# Altium project Curso_Titans.PrjPcb (part 4 of 4)
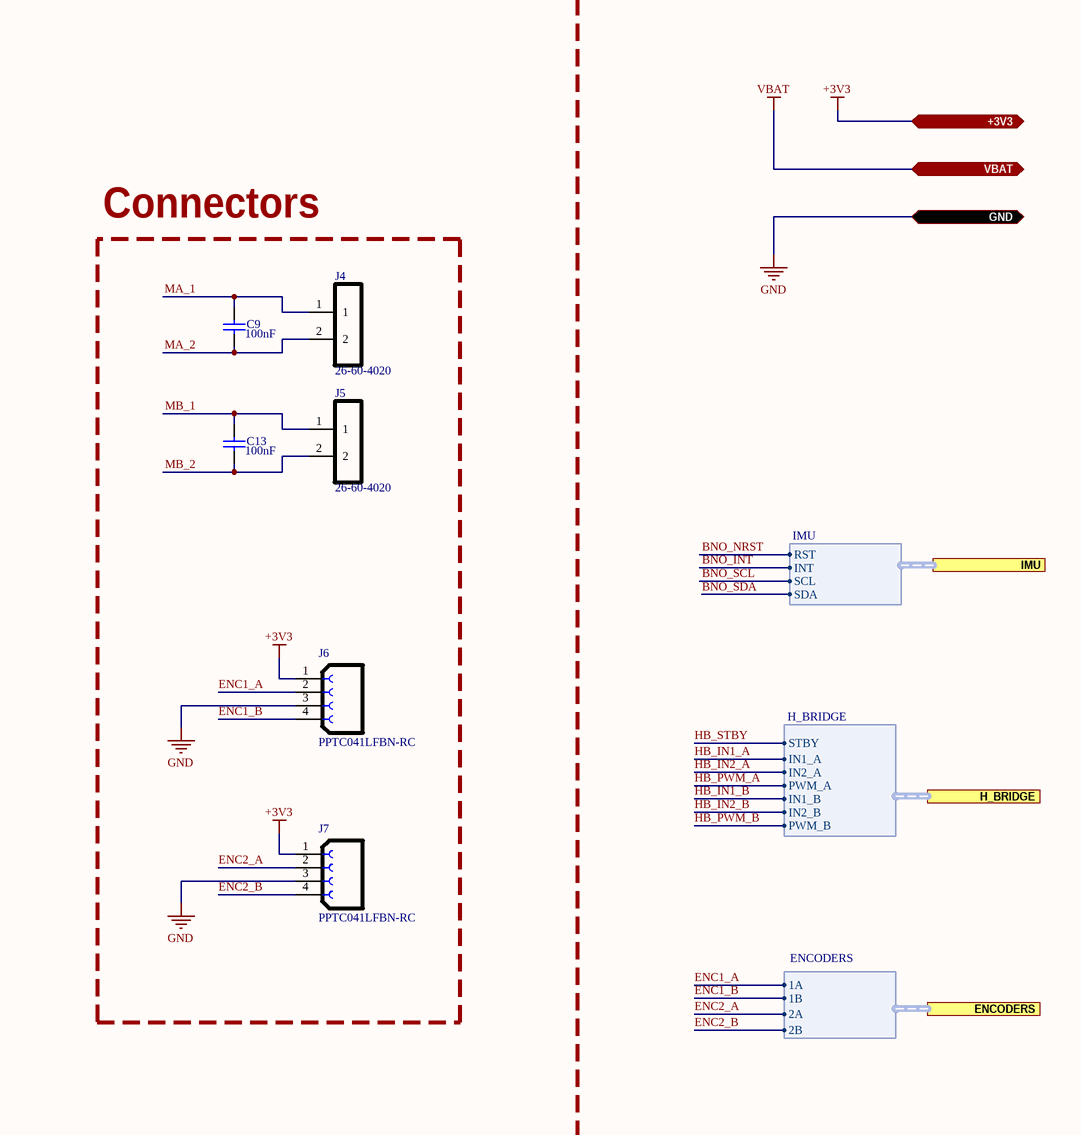
[diagram p7: peripherials.SchDoc, right]

## Nets that join several sheets
+3V3: power_supply (5 pins), logic_control (8 pins), peripherials (10 pins)
GND: power_supply (18 pins), logic_control (23 pins), peripherials (24 pins)
VBAT: power_supply (D1.2 J2.1 SW1.3), peripherials (7 pins)
BNO_INT: logic_control (U2.9), peripherials (U3.14)
BNO_NRST: logic_control (U2.8), peripherials (U3.11)
BNO_SCL: logic_control (R8.1 U2.23), peripherials (U3.19)
BNO_SDA: logic_control (R9.1 U2.31), peripherials (U3.20)
ENC1_A: logic_control (U2.19), peripherials (J6.2)
ENC1_B: logic_control (U2.20), peripherials (J6.4)
ENC2_A: logic_control (U2.21), peripherials (J7.2)
ENC2_B: logic_control (U2.22), peripherials (J7.4)
HB_IN1_A: logic_control (U2.5), peripherials (U4.21)
HB_IN1_B: logic_control (U2.12), peripherials (U4.17)
HB_IN2_A: logic_control (U2.6), peripherials (U4.22)
HB_IN2_B: logic_control (U2.17), peripherials (U4.16)
HB_PWM_A: logic_control (U2.7), peripherials (U4.23)
HB_PWM_B: logic_control (U2.18), peripherials (U4.15)
HB_STBY: logic_control (U2.4), peripherials (U4.19)
USB_MCU_N: power_supply (U1.3), logic_control (R13.1)
USB_MCU_P: power_supply (U1.1), logic_control (R14.1)